# Altium project Ezlo_Voice_AssistantHUB.PrjPcb (part 9 of 10)

## Sheet SDIO_SDMMC_Sheet.SchDoc
size A4; DocumentNumber: 18; SheetNumber: 18; SheetTotal: 27
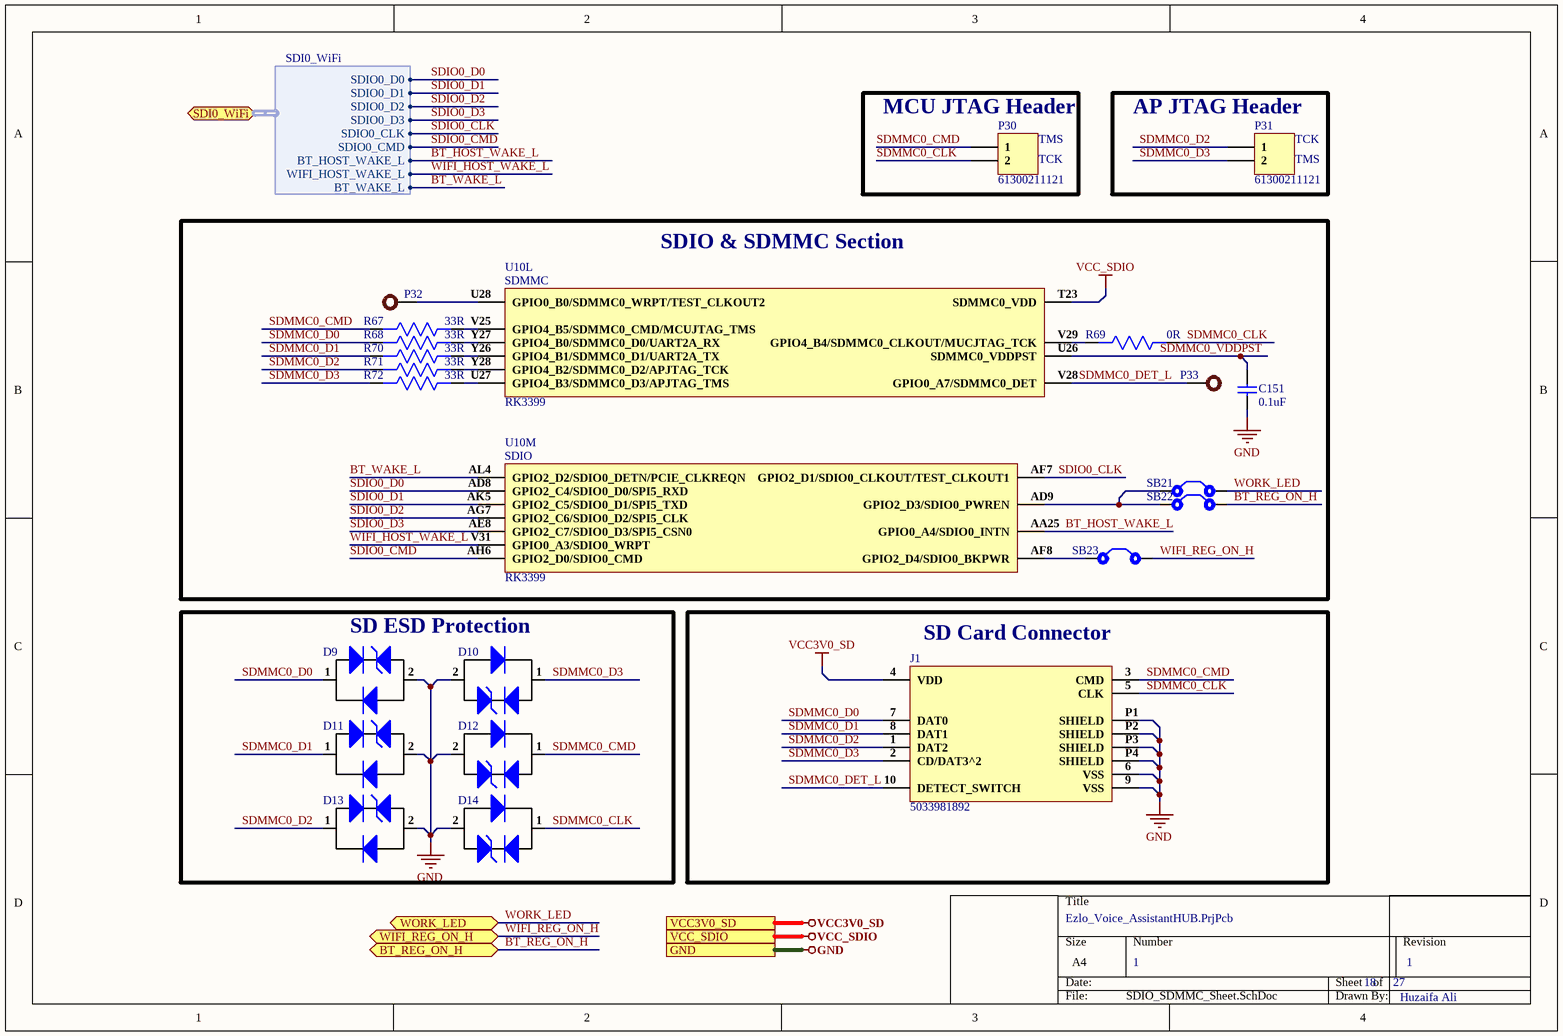
[diagram p20: SDIO_SDMMC_Sheet.SchDoc]

### Parts
C151  0.1uF  [Cap0402]
D9  ESD9X5VU  [DFN1006-2L]  (value not drawn)
D10  ESD9X5VU  [DFN1006-2L]  (value not drawn)
D11  ESD9X5VU  [DFN1006-2L]  (value not drawn)
D12  ESD9X5VU  [DFN1006-2L]  (value not drawn)
D13  ESD9X5VU  [DFN1006-2L]  (value not drawn)
D14  ESD9X5VU  [DFN1006-2L]  (value not drawn)
J1  5033981892  [503398-1892]
P30  61300211121  [HDR1X2]
P31  61300211121  [HDR1X2]
P32  Test Point  [TEST POINT]  (value not drawn)
P33  TEST POINT  [TEST POINT]  (value not drawn)
R67  33R  [Res0603]
R68  33R  [Res0603]
R69  0R  [Res0603]
R70  33R  [Res0603]
R71  33R  [Res0603]
R72  33R  [Res0603]
SB21  Solder Bridge  [Solder Bridge]  (value not drawn)
SB22  Solder Bridge  [Solder Bridge]  (value not drawn)
SB23  Solder Bridge  [Solder Bridge]  (value not drawn)
U10  RK3399  [RK3399]  (parts L,M of 34)

### Blocks framed on the sheet
MCU JTAG Header: P30
AP JTAG Header: P31
SDIO & SDMMC Section: C151 P32 P33 R67-R72 SB21-SB23 U10
SD ESD Protection: D9-D14
SD Card Connector: J1

### Ports
BT_REG_ON_H (bidir), GND, SDI0_WiFi (bidir, harness SDI0_WiFi), VCC3V0_SD, VCC_SDIO, WIFI_REG_ON_H (bidir), WORK_LED (bidir)

### Harnesses
SDI0_WiFi: SDIO0_D0, SDIO0_D1, SDIO0_D2, SDIO0_D3, SDIO0_CLK, SDIO0_CMD, BT_HOST_WAKE_L, WIFI_HOST_WAKE_L, BT_WAKE_L

### Nets
GND: C151.1 D9.2 D10.2 D11.2 D12.2 D13.2 D14.2 J1.6(VSS) J1.9(VSS) J1.P1(SHIELD) J1.P2(SHIELD) J1.P3(SHIELD) J1.P4(SHIELD) ; port GND
VCC3V0_SD: J1.4(VDD) ; port VCC3V0_SD
VCC_SDIO: U10.T23(SDMMC0_VDD) ; port VCC_SDIO
BT_HOST_WAKE_L: U10.AA25(GPIO0_A4/SDIO0_INTN) ; port SDI0_WiFi.BT_HOST_WAKE_L
BT_REG_ON_H: SB22.2 ; port BT_REG_ON_H
BT_WAKE_L: U10.AL4(GPIO2_D2/SDIO0_DETN/PCIE_CLKREQN) ; port SDI0_WiFi.BT_WAKE_L
SDIO0_CLK: U10.AF7(GPIO2_D1/SDIO0_CLKOUT/TEST_CLKOUT1) ; port SDI0_WiFi.SDIO0_CLK  [project net SDI0_WiFi.SDIO0_CLK]
SDIO0_CMD: U10.AH6(GPIO2_D0/SDIO0_CMD) ; port SDI0_WiFi.SDIO0_CMD  [project net SDI0_WiFi.SDIO0_CMD]
SDIO0_D0: U10.AD8(GPIO2_C4/SDIO0_D0/SPI5_RXD) ; port SDI0_WiFi.SDIO0_D0  [project net SDI0_WiFi.SDIO0_D0]
SDIO0_D1: U10.AK5(GPIO2_C5/SDIO0_D1/SPI5_TXD) ; port SDI0_WiFi.SDIO0_D1  [project net SDI0_WiFi.SDIO0_D1]
SDIO0_D2: U10.AG7(GPIO2_C6/SDIO0_D2/SPI5_CLK) ; port SDI0_WiFi.SDIO0_D2  [project net SDI0_WiFi.SDIO0_D2]
SDIO0_D3: U10.AE8(GPIO2_C7/SDIO0_D3/SPI5_CSN0) ; port SDI0_WiFi.SDIO0_D3  [project net SDI0_WiFi.SDIO0_D3]
SDMMC0_CLK: D14.1 J1.5(CLK) P30.2 R69.1
SDMMC0_CMD: D12.1 J1.3(CMD) P30.1 R67.2
SDMMC0_D0: D9.1 J1.7(DAT0) R68.2
SDMMC0_D1: D11.1 J1.8(DAT1) R70.2
SDMMC0_D2: D13.1 J1.1(DAT2) P31.1 R71.2
SDMMC0_D3: D10.1 J1.2(CD/DAT3^2) P31.2 R72.2
SDMMC0_DET_L: J1.10(DETECT_SWITCH) P33.1 U10.V28(GPIO0_A7/SDMMC0_DET)
SDMMC0_VDDPST: C151.2 U10.U26(SDMMC0_VDDPST)
WIFI_HOST_WAKE_L: U10.V31(GPIO0_A3/SDIO0_WRPT) ; port SDI0_WiFi.WIFI_HOST_WAKE_L  [project net SDI0_WiFi.WIFI_HOST_WAKE_L]
WIFI_REG_ON_H: SB23.2 ; port WIFI_REG_ON_H
WORK_LED: SB21.2 ; port WORK_LED
NetP32_1: P32.1 U10.U28(GPIO0_B0/SDMMC0_WRPT/TEST_CLKOUT2)
NetR67_1: R67.1 U10.V25(GPIO4_B5/SDMMC0_CMD/MCUJTAG_TMS)
NetR68_1: R68.1 U10.Y27(GPIO4_B0/SDMMC0_D0/UART2A_RX)
NetR69_2: R69.2 U10.V29(GPIO4_B4/SDMMC0_CLKOUT/MUCJTAG_TCK)
NetR70_1: R70.1 U10.Y26(GPIO4_B1/SDMMC0_D1/UART2A_TX)
NetR71_1: R71.1 U10.Y28(GPIO4_B2/SDMMC0_D2/APJTAG_TCK)
NetR72_1: R72.1 U10.U27(GPIO4_B3/SDMMC0_D3/APJTAG_TMS)
NetSB21_1: SB21.1 SB22.1 U10.AD9(GPIO2_D3/SDIO0_PWREN)
NetSB23_1: SB23.1 U10.AF8(GPIO2_D4/SDIO0_BKPWR)

### Notes on the sheet
- (near P30) TMS
- (near P30) TCK
- (near P31) TCK
- (near P31) TMS
- 1
- Huzaifa Ali
- (in symbol RK3399, part L) SDMMC
- (in symbol RK3399, part M) SDIO

### Library data of the parts
C151 = CC0402KRX5R6BB104: as C152-C160 on sheet USB_Sheet; Supplier 1: Digi-Key; Manufacturer Part Number: CC0402KRX5R6BB104; RoHS: Yes; Category: Ceramic Capacitors; Stock 1: 6385580; Pricing 1: 1=0.10000, 10=0.02700, 50=0.01500, 100=0.01220, 500=0.00874, 1000=0.00687, 2500=0.00625, 5000=0.00575 (USD); Mount: Surface Mount; Case/Package: 0402; Number of Pins: 2; Case Code (Imperial): 0402; Case Code (Metric): 1005; Min Operating Temperature: -55°C; Max Operating Temperature: 85°C; Dielectric: X5R; Packaging: Tape and Reel; Voltage Rating: 10V; Package Quantity: 1; Termination: SMD/SMT; Voltage Rating (DC): 10V; Series: CC; Length: 1mm; Width: 0.02inch; Height: 0.5mm; Depth: 0.5mm; Thickness: 0.022inch; Radiation Hardening: No; RoHS Compliant: Yes; REACH SVHC: No SVHC; Lead Free: Lead Free; Halogen Free: Halogen Free; ComponentLink1URL: https://datasheet.ciiva.com/144/mlccorderingcode-144029.pdf?src-supplier=Digi-Key; ComponentLink1Description: https://datasheet.ciiva.com/144/mlccorderingcode-144029.pdf?src-supplier=Digi-Key; ComponentLink2URL: https://datasheet.ciiva.com/144/mlccorderingcode-144028.pdf?src-supplier=Digi-Key; ComponentLink2Description: https://datasheet.ciiva.com/144/mlccorderingcode-144028.pdf?src-supplier=Digi-Key; ComponentLink3URL: https://datasheet.ciiva.com/144/mlccorderingcode-144030.pdf?src-supplier=Digi-Key; ComponentLink3Description: https://datasheet.ciiva.com/144/mlccorderingcode-144030.pdf?src-supplier=Digi-Key; ComponentLink4URL: https://datasheet.ciiva.com/7978/1359354-7978091.pdf?src-supplier=Element14; ComponentLink4Description: https://datasheet.ciiva.com/7978/1359354-7978091.pdf?src-supplier=Element14; ComponentLink5URL: https://datasheet.ciiva.com/11587/upy-gphc-x5r-4v-to-50v-12-11587302.pdf?src-supplier=Avnet; ComponentLink5Description: https://datasheet.ciiva.com/11587/upy-gphc-x5r-4v-to-50v-12-11587302.pdf?src-supplier=Avnet; Supplier Part Number 1: 311-1336-1-ND
D9-D14 = ESD9X5VU: DFN1006-2 ESD Protection Devices ROHS; Manufacturer: TECH PUBLIC; Manufacturer Part Number: ESD9X5VU; Footprint: DFN1006-2; ComponentLink1Description: LCSC; ComponentLink1URL: https://www.lcsc.com/product-detail/span-style-background-color-ff0-ESD-span-Protection-Devices_TECH-PUBLIC-ESD9X5VU_C2875160.html
J1 = 5033981892: MICRO SD PUSH/PUSH SMALL 8C; Manufacturer: Molex; Supplier 1: Arrow Electronics; Manufacturer Part Number: 503398-1892; RoHS: Yes; Category: Memory Connectors; Stock 1: 14535; Pricing 1: 1=2.47900, 10=2.18900, 25=2.17400, 100=1.81200 (USD); ComponentLink1URL: https://datasheet.ciiva.com/29723/5033981892-sd-29723401.pdf?src-supplier=Digi-Key; ComponentLink1Description: https://datasheet.ciiva.com/29723/5033981892-sd-29723401.pdf?src-supplier=Digi-Key; ComponentLink2URL: https://datasheet.ciiva.com/22744/1740946-22744573.pdf?src-supplier=Element14; ComponentLink2Description: https://datasheet.ciiva.com/22744/1740946-22744573.pdf?src-supplier=Element14; ComponentLink3URL: https://datasheet.ciiva.com/23941/1740947-23941665.pdf?src-supplier=Newark; ComponentLink3Description: https://datasheet.ciiva.com/23941/1740947-23941665.pdf?src-supplier=Newark; Supplier Part Number 1: 503398-1892
P30 P31 = 61300211121: CONN HEADER VERT 2POS 2.54MM; Manufacturer: Wurth Electronics; Current Rating: 3A; Voltage Rating: 250V; Number of Positions: 2; Gender: Male; Connector Type: Male Pin; Pitch: 0.1inch; Supplier 1: Digi-Key; Manufacturer Part Number: 61300211121; Stock 1: 219205; Pricing 1: 1=0.13, 10=0.106, 25=0.088, 50=0.074, 100=0.067, 1000=0.061 (USD); Mount: Through Hole; Contact Plating: Gold; Housing Material: PBT; Contact Material: Copper Alloy,Copper; Color: Black; Min Operating Temperature: -40°C; Max Operating Temperature: 125°C; Number of Rows: 1; Contact Gender: Male; Packaging: Bulk; Termination: Through Hole; Number of Contacts: 2; Contact Mating Length: 0.236inch; REACH SVHC: Unknown; Lead Free: Lead Free; ComponentLink1URL: http://www.mouser.com/ds/2/445/6130xx11121-538006.pdf?src-supplier=Mouser; ComponentLink1Description: http://www.mouser.com/ds/2/445/6130xx11121-538006.pdf?src-supplier=Mouser; Supplier Part Number 1: 732-5315-ND
P32 P33 = TEST POINT: Test Point ON
R67 R68 R70-R72 = RC0603FR-0733RL: RES SMD 33 OHM 1% 1/10W 0603; Manufacturer: Yageo; Temperature Coefficient: 100ppm/°C; Voltage Rating (DC): 50V; Power Rating: 100mW; Voltage Rating: 75V; Supplier 1: Digi-Key; Manufacturer Part Number: RC0603FR-0733RL; Stock 1: 5529439; Pricing 1: 1=0.1, 10=0.023, 100=0.0094, 1000=0.00421, 2500=0.00366 (USD); Case/Package: 0603; Number of Pins: 2; Weight: 7.1E-05oz; Case Code (Metric): 1608; Case Code (Imperial): 0603; Min Operating Temperature: -55°C; Max Operating Temperature: 155°C; Resistance: 33R; Tolerance: 1%; Composition: Thick Film; Packaging: Tape and Reel; Package Quantity: 1; Number of Terminations: 2; Termination: SMD/SMT; Military Standard: Not; Max Power Dissipation: 100mW; Features: Moisture Resistant; Length: 1.6mm; Height: 0.45mm; Width: 0.8mm; Depth: 0.8mm; Lead Pitch: 0.3mm; REACH SVHC: No SVHC; Lead Free: Lead Free; ComponentLink1URL: http://www.yageo.com/documents/recent/PYu-RC_Group_51_RoHS_L_10.pdf?src-supplier=Digi-Key; ComponentLink1Description: http://www.yageo.com/documents/recent/PYu-RC_Group_51_RoHS_L_10.pdf?src-supplier=Digi-Key; ComponentLink2URL: http://documents.rs-components.com/techlib://itc_doclist_GB.htm?stockno=5046562&src-supplier=RSComponents; ComponentLink2Description: http://documents.rs-components.com/techlib://itc_doclist_GB.htm?stockno=5046562&src-supplier=RSComponents; ComponentLink3URL: http://www.farnell.com/datasheets/38590.pdf?src-supplier=Element14; ComponentLink3Description: http://www.farnell.com/datasheets/38590.pdf?src-supplier=Element14; ComponentLink4URL: https://www.verical.com/server-webapp/html/getDatasheet?partID=326673&src-supplier=Verical; ComponentLink4Description: https://www.verical.com/server-webapp/html/getDatasheet?partID=326673&src-supplier=Verical; ComponentLink5URL: http://www.farnell.com/datasheets/1868787.pdf?src-supplier=Element14; ComponentLink5Description: http://www.farnell.com/datasheets/1868787.pdf?src-supplier=Element14; ComponentLink6URL: http://www.farnell.com/datasheets/2167052.pdf?src-supplier=Element14; ComponentLink6Description: http://www.farnell.com/datasheets/2167052.pdf?src-supplier=Element14; ComponentLink7URL: http://www.farnell.com/datasheets/443971.pdf?src-supplier=Element14; ComponentLink7Description: http://www.farnell.com/datasheets/443971.pdf?src-supplier=Element14; Supplier Part Number 1: 311-33.0HRCT-ND
R69 = RC0603FR-070RL: RES SMD 0R, 1%, 0.1W, 0603; Manufacturer: Yageo; Resistance: 0mR; Power Rating: 100mW; Voltage Rating (DC): 50V; Temperature Coefficient: 200ppm/°C; Current Rating: 1A; Working Voltage: 75V; Supplier 1: Arrow Electronics; Manufacturer Part Number: RC0603FR-070RL; RoHS: Yes; Category: Chip SMD Resistors; Stock 1: 1270000; Pricing 1: 5000=0.00320, 5000=0.00490, 50000=0.00450, 500000=0.00250, 2500000=0.00150 (USD); Case/Package: 0603; Number of Pins: 2; Contact Plating: Tin,Matte; Case Code (Metric): 1608; Case Code (Imperial): 0603; Min Operating Temperature: -55°C; Max Operating Temperature: 155°C; Resistor Type: Thick Film; Packaging: Tape and Reel; Tolerance: 1%; Package Quantity: 5000; Voltage Rating: 50V; Number of Terminations: 2; Termination: SMD/SMT; Max Power Dissipation: 100mW; Features: Moisture Resistant; Length: 1.6mm; Width: 0.031inch; Height: 0.45mm; Depth: 0.8mm; Radiation Hardening: No; REACH SVHC: No SVHC; Lead Free: Lead Free; Military Standard: Not; ComponentLink1URL: https://datasheet.ciiva.com/11808/0900766b80f96399-11808172.pdf?src-supplier=RSComponents; ComponentLink1Description: https://datasheet.ciiva.com/11808/0900766b80f96399-11808172.pdf?src-supplier=RSComponents; ComponentLink2URL: https://datasheet.ciiva.com/5558/rc0603-272842-5558341.pdf?src-supplier=Mouser; ComponentLink2Description: https://datasheet.ciiva.com/5558/rc0603-272842-5558341.pdf?src-supplier=Mouser; ComponentLink3URL: https://datasheet.ciiva.com/46382/443971-46382072.pdf?src-supplier=Element14; ComponentLink3Description: https://datasheet.ciiva.com/46382/443971-46382072.pdf?src-supplier=Element14; ComponentLink4URL: https://datasheet.ciiva.com/29721/pyu-r-int-thick-7-29721178.pdf?src-supplier=Digi-Key; ComponentLink4Description: https://datasheet.ciiva.com/29721/pyu-r-int-thick-7-29721178.pdf?src-supplier=Digi-Key; ComponentLink5URL: https://datasheet.ciiva.com/5684/443971-5684699.pdf?src-supplier=Farnell; ComponentLink5Description: https://datasheet.ciiva.com/5684/443971-5684699.pdf?src-supplier=Farnell; ComponentLink6URL: https://datasheet.ciiva.com/7983/443971-7983627.pdf?src-supplier=Element14; ComponentLink6Description: https://datasheet.ciiva.com/7983/443971-7983627.pdf?src-supplier=Element14; ComponentLink7URL: https://datasheet.ciiva.com/29721/pyu-rc0603-51-rohs-l-4-29721179.pdf?src-supplier=Digi-Key; ComponentLink7Description: https://datasheet.ciiva.com/29721/pyu-rc0603-51-rohs-l-4-29721179.pdf?src-supplier=Digi-Key; ComponentLink8URL: https://datasheet.ciiva.com/22643/1868787-22643388.pdf?src-supplier=Element14; ComponentLink8Description: https://datasheet.ciiva.com/22643/1868787-22643388.pdf?src-supplier=Element14; Supplier Part Number 1: RC0603FR-070RL
SB21-SB23 = Solder Bridge: Solder Bridge ON
U10 = RK3399: RK3399 CPU BGA for HD set-top box chip BGA Chipse; Manufacturer: Fuzhou Rockchip Electronics; ComponentLink1Description: Aliexpress; ComponentLink1URL: https://www.aliexpress.com/item/1005001971093459.html?spm=a2g0n.productlist.0.0.3c7csv8Qsv8Quh&browser_id=3ac7e9efb8074641aaabc4d871f09748&aff_trace_key=&aff_platform=msite&m_page_id=181389a08711fc2600d8cc522bab8d702dd4189be0&gclid=&pdp_npi=2%40dis%21USD%21%2123.6%21%21%21%21%21%402101d91e16545120399167831e8b89%21%21sea&algo_pvid=4303aedd-774c-4013-953d-920f10b55003; Manufacturer Part Number: RK3399; Footprint: FCBGA828

## Sheet DDRC_Section.SchDoc: =Projectname
size A4; DocumentNumber: 9; SheetNumber: 9; SheetTotal: 27
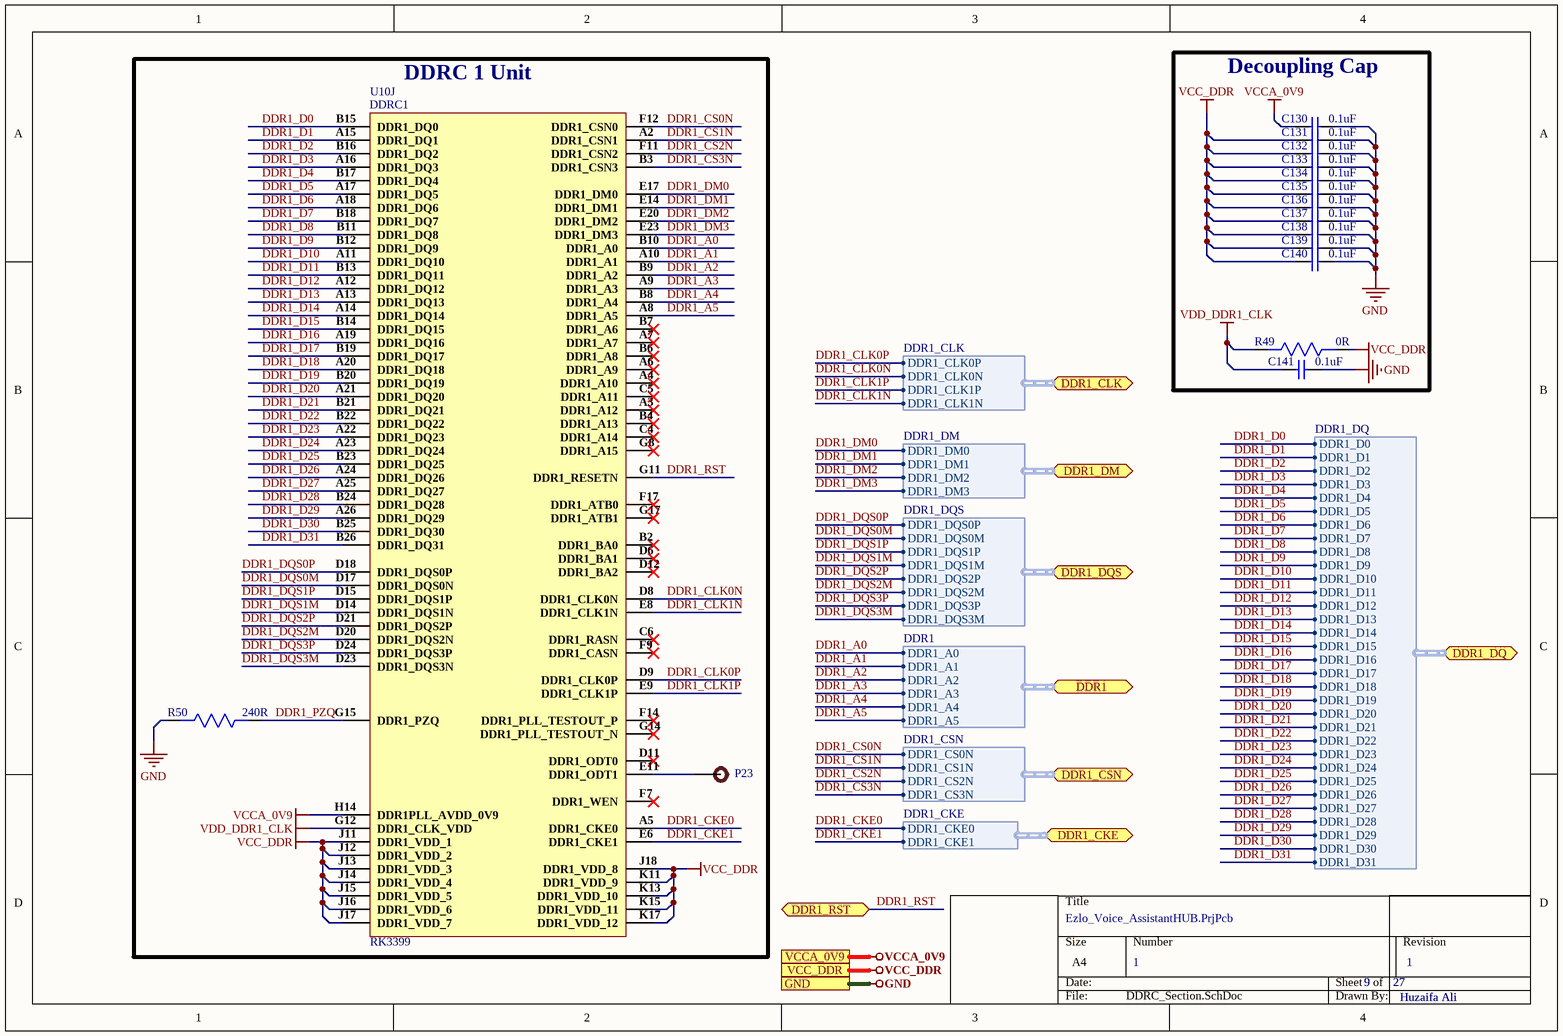
[diagram p21: DDRC_Section.SchDoc]

### Parts
C130  0.1uF  [Cap0402]
C131  0.1uF  [Cap0402]
C132  0.1uF  [Cap0402]
C133  0.1uF  [Cap0402]
C134  0.1uF  [Cap0402]
C135  0.1uF  [Cap0402]
C136  0.1uF  [Cap0402]
C137  0.1uF  [Cap0402]
C138  0.1uF  [Cap0402]
C139  0.1uF  [Cap0402]
C140  0.1uF  [Cap0402]
C141  0.1uF  [Cap0402]
P23  Test Point  [TEST POINT]  (value not drawn)
R49  0R  [Res0603]
R50  240R  [Res0603]
U10  RK3399  [RK3399]  (part J of 34)

### Blocks framed on the sheet
DDRC 1 Unit: P23 R50 U10
Decoupling Cap: C130-C141 R49

### Ports
DDR1 (bidir, harness DDR1), DDR1_CKE (bidir, harness DDR1_CKE), DDR1_CLK (bidir, harness DDR1_CLK), DDR1_CSN (bidir, harness DDR1_CSN), DDR1_DM (bidir, harness DDR1_DM), DDR1_DQ (bidir, harness DDR1_DQ), DDR1_DQS (bidir, harness DDR1_DQS), DDR1_RST (bidir), GND, VCC_DDR, VCCA_0V9

### Harnesses
DDR1_DQ: DDR1_D0, DDR1_D1, DDR1_D2, DDR1_D3, DDR1_D4, DDR1_D5, DDR1_D6, DDR1_D7, DDR1_D8, DDR1_D9, DDR1_D10, DDR1_D11, DDR1_D12, DDR1_D13, DDR1_D14, DDR1_D15, DDR1_D16, DDR1_D17, DDR1_D18, DDR1_D19, DDR1_D20, DDR1_D21, DDR1_D22, DDR1_D23, DDR1_D24, DDR1_D25, DDR1_D26, DDR1_D27, DDR1_D28, DDR1_D29, DDR1_D30, DDR1_D31
DDR1_DM: DDR1_DM0, DDR1_DM1, DDR1_DM2, DDR1_DM3
DDR1_DQS: DDR1_DQS0P, DDR1_DQS0M, DDR1_DQS1P, DDR1_DQS1M, DDR1_DQS2P, DDR1_DQS2M, DDR1_DQS3P, DDR1_DQS3M
DDR1: DDR1_A0, DDR1_A1, DDR1_A2, DDR1_A3, DDR1_A4, DDR1_A5
DDR1_CSN: DDR1_CS0N, DDR1_CS1N, DDR1_CS2N, DDR1_CS3N
DDR1_CKE: DDR1_CKE0, DDR1_CKE1
DDR1_CLK: DDR1_CLK0P, DDR1_CLK0N, DDR1_CLK1P, DDR1_CLK1N

### Nets
GND: C130.2 C131.2 C132.2 C133.2 C134.2 C135.2 C136.2 C137.2 C138.2 C139.2 C140.2 C141.2 R50.2 ; port GND
VCC_DDR: C131.1 C132.1 C133.1 C134.1 C135.1 C136.1 C137.1 C138.1 C139.1 C140.1 R49.1 U10.J11(DDR1_VDD_1) U10.J12(DDR1_VDD_2) U10.J13(DDR1_VDD_3) U10.J14(DDR1_VDD_4) U10.J15(DDR1_VDD_5) U10.J16(DDR1_VDD_6) U10.J17(DDR1_VDD_7) U10.J18(DDR1_VDD_8) U10.K11(DDR1_VDD_9) U10.K13(DDR1_VDD_10) U10.K15(DDR1_VDD_11) U10.K17(DDR1_VDD_12) ; port VCC_DDR
VCCA_0V9: C130.1 U10.H14(DDR1PLL_AVDD_0V9) ; port VCCA_0V9
VDD_DDR1_CLK: C141.1 R49.2 U10.G12(DDR1_CLK_VDD)
DDR1_A0: U10.B10(DDR1_A0) ; port DDR1.DDR1_A0  [project net DDR1.DDR1_A0]
DDR1_A1: U10.A10(DDR1_A1) ; port DDR1.DDR1_A1  [project net DDR1.DDR1_A1]
DDR1_A2: U10.B9(DDR1_A2) ; port DDR1.DDR1_A2  [project net DDR1.DDR1_A2]
DDR1_A3: U10.A9(DDR1_A3) ; port DDR1.DDR1_A3  [project net DDR1.DDR1_A3]
DDR1_A4: U10.B8(DDR1_A4) ; port DDR1.DDR1_A4  [project net DDR1.DDR1_A4]
DDR1_A5: U10.A8(DDR1_A5) ; port DDR1.DDR1_A5  [project net DDR1.DDR1_A5]
DDR1_CKE0: U10.A5(DDR1_CKE0) ; port DDR1_CKE.DDR1_CKE0  [project net DDR1_CKE.DDR1_CKE0]
DDR1_CKE1: U10.E6(DDR1_CKE1) ; port DDR1_CKE.DDR1_CKE1  [project net DDR1_CKE.DDR1_CKE1]
DDR1_CLK0N: U10.D8(DDR1_CLK0N) ; port DDR1_CLK.DDR1_CLK0N  [project net DDR1_CLK.DDR1_CLK0N]
DDR1_CLK0P: U10.D9(DDR1_CLK0P) ; port DDR1_CLK.DDR1_CLK0P  [project net DDR1_CLK.DDR1_CLK0P]
DDR1_CLK1N: U10.E8(DDR1_CLK1N) ; port DDR1_CLK.DDR1_CLK1N  [project net DDR1_CLK.DDR1_CLK1N]
DDR1_CLK1P: U10.E9(DDR1_CLK1P) ; port DDR1_CLK.DDR1_CLK1P  [project net DDR1_CLK.DDR1_CLK1P]
DDR1_CS0N: U10.F12(DDR1_CSN0) ; port DDR1_CSN.DDR1_CS0N
DDR1_CS1N: U10.A2(DDR1_CSN1) ; port DDR1_CSN.DDR1_CS1N
DDR1_CS2N: U10.F11(DDR1_CSN2) ; port DDR1_CSN.DDR1_CS2N
DDR1_CS3N: U10.B3(DDR1_CSN3) ; port DDR1_CSN.DDR1_CS3N
DDR1_D0: U10.B15(DDR1_DQ0) ; port DDR1_DQ.DDR1_D0
DDR1_D1: U10.A15(DDR1_DQ1) ; port DDR1_DQ.DDR1_D1
DDR1_D2: U10.B16(DDR1_DQ2) ; port DDR1_DQ.DDR1_D2
DDR1_D3: U10.A16(DDR1_DQ3) ; port DDR1_DQ.DDR1_D3
DDR1_D4: U10.B17(DDR1_DQ4) ; port DDR1_DQ.DDR1_D4
DDR1_D5: U10.A17(DDR1_DQ5) ; port DDR1_DQ.DDR1_D5
DDR1_D6: U10.A18(DDR1_DQ6) ; port DDR1_DQ.DDR1_D6
DDR1_D7: U10.B18(DDR1_DQ7) ; port DDR1_DQ.DDR1_D7
DDR1_D8: U10.B11(DDR1_DQ8) ; port DDR1_DQ.DDR1_D8
DDR1_D9: U10.B12(DDR1_DQ9) ; port DDR1_DQ.DDR1_D9
DDR1_D10: U10.A11(DDR1_DQ10) ; port DDR1_DQ.DDR1_D10
DDR1_D11: U10.B13(DDR1_DQ11) ; port DDR1_DQ.DDR1_D11
DDR1_D12: U10.A12(DDR1_DQ12) ; port DDR1_DQ.DDR1_D12
DDR1_D13: U10.A13(DDR1_DQ13) ; port DDR1_DQ.DDR1_D13
DDR1_D14: U10.A14(DDR1_DQ14) ; port DDR1_DQ.DDR1_D14
DDR1_D15: U10.B14(DDR1_DQ15) ; port DDR1_DQ.DDR1_D15
DDR1_D16: U10.A19(DDR1_DQ16) ; port DDR1_DQ.DDR1_D16
DDR1_D17: U10.B19(DDR1_DQ17) ; port DDR1_DQ.DDR1_D17
DDR1_D18: U10.A20(DDR1_DQ18) ; port DDR1_DQ.DDR1_D18
DDR1_D19: U10.B20(DDR1_DQ19) ; port DDR1_DQ.DDR1_D19
DDR1_D20: U10.A21(DDR1_DQ20) ; port DDR1_DQ.DDR1_D20
DDR1_D21: U10.B21(DDR1_DQ21) ; port DDR1_DQ.DDR1_D21
DDR1_D22: U10.B22(DDR1_DQ22) ; port DDR1_DQ.DDR1_D22
DDR1_D23: U10.A22(DDR1_DQ23) ; port DDR1_DQ.DDR1_D23
DDR1_D24: U10.A23(DDR1_DQ24) ; port DDR1_DQ.DDR1_D24
DDR1_D25: U10.B23(DDR1_DQ25) ; port DDR1_DQ.DDR1_D25
DDR1_D26: U10.A24(DDR1_DQ26) ; port DDR1_DQ.DDR1_D26
DDR1_D27: U10.A25(DDR1_DQ27) ; port DDR1_DQ.DDR1_D27
DDR1_D28: U10.B24(DDR1_DQ28) ; port DDR1_DQ.DDR1_D28
DDR1_D29: U10.A26(DDR1_DQ29) ; port DDR1_DQ.DDR1_D29
DDR1_D30: U10.B25(DDR1_DQ30) ; port DDR1_DQ.DDR1_D30
DDR1_D31: U10.B26(DDR1_DQ31) ; port DDR1_DQ.DDR1_D31
DDR1_DM0: U10.E17(DDR1_DM0) ; port DDR1_DM.DDR1_DM0  [project net DDR1_DM.DDR1_DM0]
DDR1_DM1: U10.E14(DDR1_DM1) ; port DDR1_DM.DDR1_DM1  [project net DDR1_DM.DDR1_DM1]
DDR1_DM2: U10.E20(DDR1_DM2) ; port DDR1_DM.DDR1_DM2  [project net DDR1_DM.DDR1_DM2]
DDR1_DM3: U10.E23(DDR1_DM3) ; port DDR1_DM.DDR1_DM3  [project net DDR1_DM.DDR1_DM3]
DDR1_DQS0M: U10.D17(DDR1_DQS0N) ; port DDR1_DQS.DDR1_DQS0M  [project net DDR1_DQS.DDR1_DQS0M]
DDR1_DQS0P: U10.D18(DDR1_DQS0P) ; port DDR1_DQS.DDR1_DQS0P  [project net DDR1_DQS.DDR1_DQS0P]
DDR1_DQS1M: U10.D14(DDR1_DQS1N) ; port DDR1_DQS.DDR1_DQS1M  [project net DDR1_DQS.DDR1_DQS1M]
DDR1_DQS1P: U10.D15(DDR1_DQS1P) ; port DDR1_DQS.DDR1_DQS1P  [project net DDR1_DQS.DDR1_DQS1P]
DDR1_DQS2M: U10.D20(DDR1_DQS2N) ; port DDR1_DQS.DDR1_DQS2M  [project net DDR1_DQS.DDR1_DQS2M]
DDR1_DQS2P: U10.D21(DDR1_DQS2P) ; port DDR1_DQS.DDR1_DQS2P  [project net DDR1_DQS.DDR1_DQS2P]
DDR1_DQS3M: U10.D23(DDR1_DQS3N) ; port DDR1_DQS.DDR1_DQS3M  [project net DDR1_DQS.DDR1_DQS3M]
DDR1_DQS3P: U10.D24(DDR1_DQS3P) ; port DDR1_DQS.DDR1_DQS3P  [project net DDR1_DQS.DDR1_DQS3P]
DDR1_PZQ: R50.1 U10.G15(DDR1_PZQ)
DDR1_RST: U10.G11(DDR1_RESETN) ; port DDR1_RST
NetP23_1: P23.1 U10.E11(DDR1_ODT1)

Not connected (* = marked no-connect by the designer): U10 A3(DDR1_A12)* A4(DDR1_A10)* A6(DDR1_A9)* A7(DDR1_A7)* B2(DDR1_BA0)* B4(DDR1_A13)* B6(DDR1_A8)* B7(DDR1_A6)* C4(DDR1_A14)* C5(DDR1_A11)* C6(DDR1_RASN)* D6(DDR1_BA1)* D11(DDR1_ODT0)* D12(DDR1_BA2)* F7(DDR1_WEN)* F9(DDR1_CASN)* F14(DDR1_PLL_TESTOUT_P)* F17(DDR1_ATB0)* G8(DDR1_A15)* G14(DDR1_PLL_TESTOUT_N)* G17(DDR1_ATB1)*

### Notes on the sheet
- Huzaifa Ali
- 1
- (in symbol RK3399, part J) DDRC1

### Library data of the parts
C130-C141 = CC0402KRX5R6BB104: as C152-C160 on sheet USB_Sheet; Supplier 1: Digi-Key; Manufacturer Part Number: CC0402KRX5R6BB104; RoHS: Yes; Category: Ceramic Capacitors; Stock 1: 6385580; Pricing 1: 1=0.10000, 10=0.02700, 50=0.01500, 100=0.01220, 500=0.00874, 1000=0.00687, 2500=0.00625, 5000=0.00575 (USD); Mount: Surface Mount; Case/Package: 0402; Number of Pins: 2; Case Code (Imperial): 0402; Case Code (Metric): 1005; Min Operating Temperature: -55°C; Max Operating Temperature: 85°C; Dielectric: X5R; Packaging: Tape and Reel; Voltage Rating: 10V; Package Quantity: 1; Termination: SMD/SMT; Voltage Rating (DC): 10V; Series: CC; Length: 1mm; Width: 0.02inch; Height: 0.5mm; Depth: 0.5mm; Thickness: 0.022inch; Radiation Hardening: No; RoHS Compliant: Yes; REACH SVHC: No SVHC; Lead Free: Lead Free; Halogen Free: Halogen Free; ComponentLink1URL: https://datasheet.ciiva.com/144/mlccorderingcode-144029.pdf?src-supplier=Digi-Key; ComponentLink1Description: https://datasheet.ciiva.com/144/mlccorderingcode-144029.pdf?src-supplier=Digi-Key; ComponentLink2URL: https://datasheet.ciiva.com/144/mlccorderingcode-144028.pdf?src-supplier=Digi-Key; ComponentLink2Description: https://datasheet.ciiva.com/144/mlccorderingcode-144028.pdf?src-supplier=Digi-Key; ComponentLink3URL: https://datasheet.ciiva.com/144/mlccorderingcode-144030.pdf?src-supplier=Digi-Key; ComponentLink3Description: https://datasheet.ciiva.com/144/mlccorderingcode-144030.pdf?src-supplier=Digi-Key; ComponentLink4URL: https://datasheet.ciiva.com/7978/1359354-7978091.pdf?src-supplier=Element14; ComponentLink4Description: https://datasheet.ciiva.com/7978/1359354-7978091.pdf?src-supplier=Element14; ComponentLink5URL: https://datasheet.ciiva.com/11587/upy-gphc-x5r-4v-to-50v-12-11587302.pdf?src-supplier=Avnet; ComponentLink5Description: https://datasheet.ciiva.com/11587/upy-gphc-x5r-4v-to-50v-12-11587302.pdf?src-supplier=Avnet; Supplier Part Number 1: 311-1336-1-ND
P23 = TEST POINT: Test Point ON
R49 = RC0603FR-070RL: as R69 on sheet SDIO_SDMMC_Sheet; Supplier 1: Arrow Electronics; Manufacturer Part Number: RC0603FR-070RL; RoHS: Yes; Category: Chip SMD Resistors; Stock 1: 1270000; Pricing 1: 5000=0.00320, 5000=0.00490, 50000=0.00450, 500000=0.00250, 2500000=0.00150 (USD); Case/Package: 0603; Number of Pins: 2; Contact Plating: Tin,Matte; Case Code (Metric): 1608; Case Code (Imperial): 0603; Min Operating Temperature: -55°C; Max Operating Temperature: 155°C; Resistor Type: Thick Film; Packaging: Tape and Reel; Tolerance: 1%; Package Quantity: 5000; Voltage Rating: 50V; Number of Terminations: 2; Termination: SMD/SMT; Max Power Dissipation: 100mW; Features: Moisture Resistant; Length: 1.6mm; Width: 0.031inch; Height: 0.45mm; Depth: 0.8mm; Radiation Hardening: No; REACH SVHC: No SVHC; Lead Free: Lead Free; Military Standard: Not; ComponentLink1URL: https://datasheet.ciiva.com/11808/0900766b80f96399-11808172.pdf?src-supplier=RSComponents; ComponentLink1Description: https://datasheet.ciiva.com/11808/0900766b80f96399-11808172.pdf?src-supplier=RSComponents; ComponentLink2URL: https://datasheet.ciiva.com/5558/rc0603-272842-5558341.pdf?src-supplier=Mouser; ComponentLink2Description: https://datasheet.ciiva.com/5558/rc0603-272842-5558341.pdf?src-supplier=Mouser; ComponentLink3URL: https://datasheet.ciiva.com/46382/443971-46382072.pdf?src-supplier=Element14; ComponentLink3Description: https://datasheet.ciiva.com/46382/443971-46382072.pdf?src-supplier=Element14; ComponentLink4URL: https://datasheet.ciiva.com/29721/pyu-r-int-thick-7-29721178.pdf?src-supplier=Digi-Key; ComponentLink4Description: https://datasheet.ciiva.com/29721/pyu-r-int-thick-7-29721178.pdf?src-supplier=Digi-Key; ComponentLink5URL: https://datasheet.ciiva.com/5684/443971-5684699.pdf?src-supplier=Farnell; ComponentLink5Description: https://datasheet.ciiva.com/5684/443971-5684699.pdf?src-supplier=Farnell; ComponentLink6URL: https://datasheet.ciiva.com/7983/443971-7983627.pdf?src-supplier=Element14; ComponentLink6Description: https://datasheet.ciiva.com/7983/443971-7983627.pdf?src-supplier=Element14; ComponentLink7URL: https://datasheet.ciiva.com/29721/pyu-rc0603-51-rohs-l-4-29721179.pdf?src-supplier=Digi-Key; ComponentLink7Description: https://datasheet.ciiva.com/29721/pyu-rc0603-51-rohs-l-4-29721179.pdf?src-supplier=Digi-Key; ComponentLink8URL: https://datasheet.ciiva.com/22643/1868787-22643388.pdf?src-supplier=Element14; ComponentLink8Description: https://datasheet.ciiva.com/22643/1868787-22643388.pdf?src-supplier=Element14; Supplier Part Number 1: RC0603FR-070RL
R50 = RT0603BRD07240RL: RES SMD 240 OHM 0.1% 1/10W 0603; Manufacturer: Yageo; Power Rating: 100mW; Voltage Rating: 75V; Temperature Coefficient: 25ppm/°C; Voltage Rating (DC): 50V; Supplier 1: Arrow Electronics; Manufacturer Part Number: RT0603BRD07240RL; RoHS: Yes; Category: Chip SMD Resistors; Stock 1: 5; Pricing 1: 1=0.13940 (USD); Case/Package: 0603; Case Code (Imperial): 0603; Case Code (Metric): 1608; Contact Plating: Tin,Matte; Min Operating Temperature: -55°C; Max Operating Temperature: 125°C; Resistance: 240R; Tolerance: 0.1%; Packaging: Tape and Reel; Resistor Type: Thin Film; Number of Terminations: 2; Termination: SMD/SMT; Max Power Dissipation: 100mW; Features: Moisture Resistant; Series: RT; Construction: Rectangular; Length: 1.6mm; Width: 0.031inch; Height: 0.022inch; Depth: 0.8mm; Radiation Hardening: No; Military Standard: Not; Lead Free: Lead Free; RoHS Compliant: Yes; ComponentLink1URL: https://datasheet.ciiva.com/8886/pyu-rt-1-to-0-05-rohs-l-4-8886602.pdf?src-supplier=Avnet; ComponentLink1Description: https://datasheet.ciiva.com/8886/pyu-rt-1-to-0-05-rohs-l-4-8886602.pdf?src-supplier=Avnet; ComponentLink2URL: https://datasheet.ciiva.com/12799/pyu-rt-1-to-0-05-rohs-l-4-12799039.pdf?src-supplier=Mouser; ComponentLink2Description: https://datasheet.ciiva.com/12799/pyu-rt-1-to-0-05-rohs-l-4-12799039.pdf?src-supplier=Mouser; Supplier Part Number 1: RT0603BRD07240RL
U10 = RK3399: as U10 on sheet SDIO_SDMMC_Sheet; ComponentLink1Description: Aliexpress; ComponentLink1URL: https://www.aliexpress.com/item/1005001971093459.html?spm=a2g0n.productlist.0.0.3c7csv8Qsv8Quh&browser_id=3ac7e9efb8074641aaabc4d871f09748&aff_trace_key=&aff_platform=msite&m_page_id=181389a08711fc2600d8cc522bab8d702dd4189be0&gclid=&pdp_npi=2%40dis%21USD%21%2123.6%21%21%21%21%21%402101d91e16545120399167831e8b89%21%21sea&algo_pvid=4303aedd-774c-4013-953d-920f10b55003; Manufacturer Part Number: RK3399; Footprint: FCBGA828

## Sheet DDRC_Sheet_2.SchDoc
size A4; DocumentNumber: 10; SheetNumber: 10; SheetTotal: 27
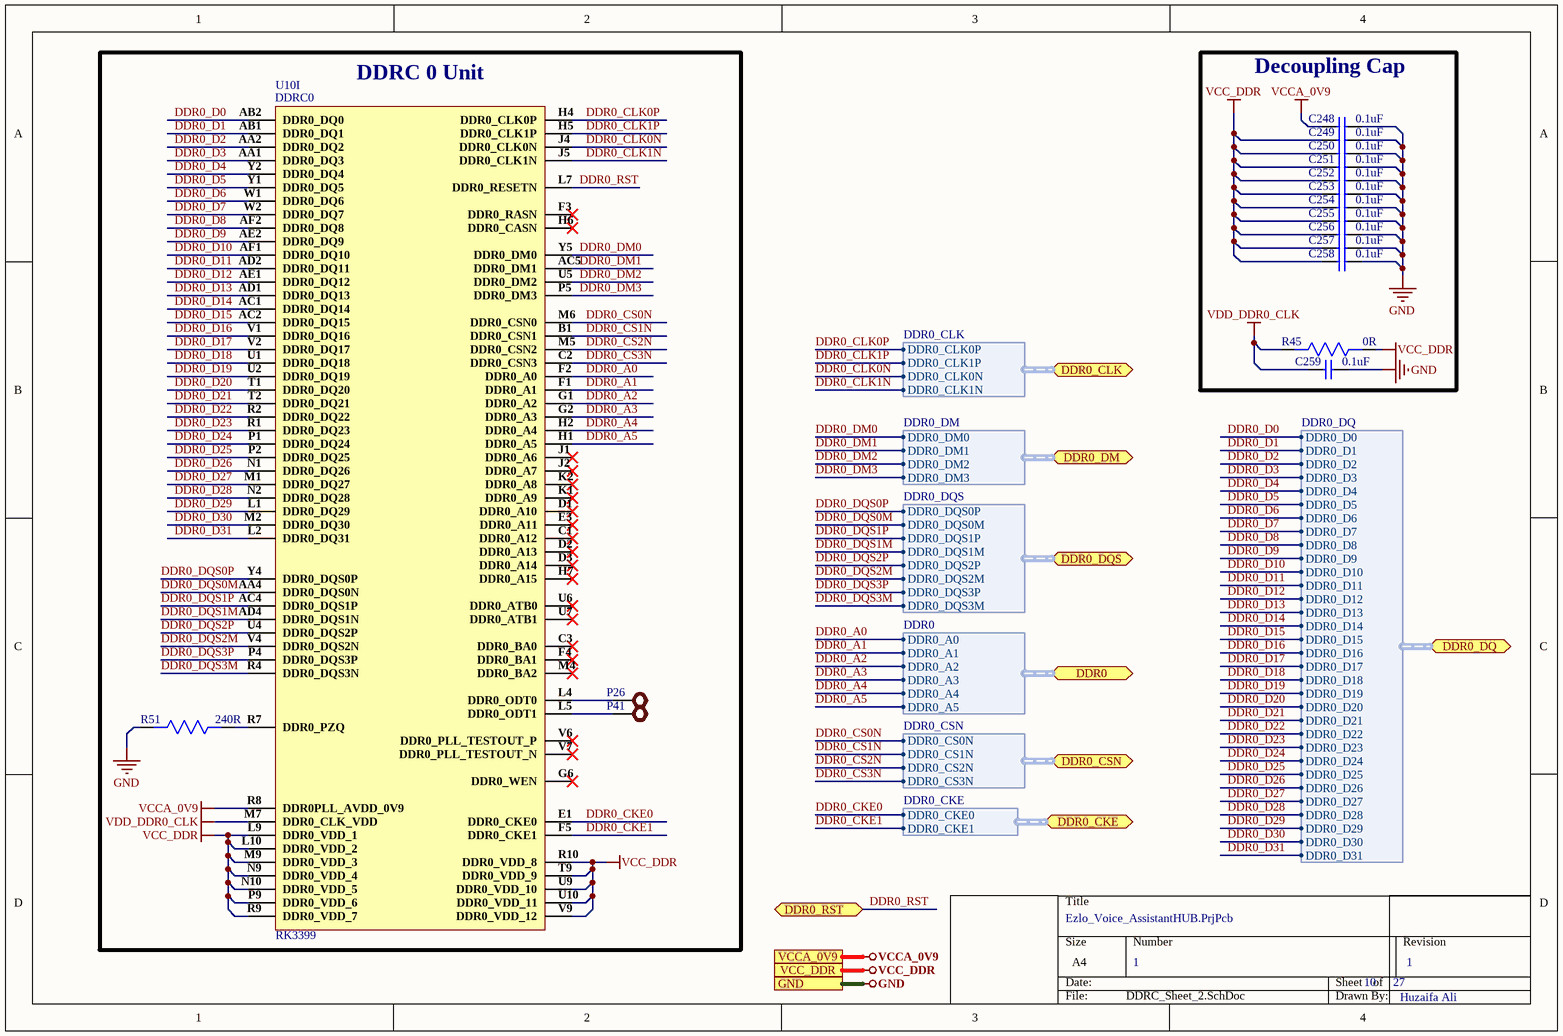
[diagram p22: DDRC_Sheet_2.SchDoc]

### Parts
C248  0.1uF  [Cap0402]
C249  0.1uF  [Cap0402]
C250  0.1uF  [Cap0402]
C251  0.1uF  [Cap0402]
C252  0.1uF  [Cap0402]
C253  0.1uF  [Cap0402]
C254  0.1uF  [Cap0402]
C255  0.1uF  [Cap0402]
C256  0.1uF  [Cap0402]
C257  0.1uF  [Cap0402]
C258  0.1uF  [Cap0402]
C259  0.1uF  [Cap0402]
P26  TEST POINT  [TEST POINT]  (value not drawn)
P41  TEST POINT  [TEST POINT]  (value not drawn)
R45  0R  [Res0603]
R51  240R  [Res0603]
U10  RK3399  [RK3399]  (part I of 34)

### Blocks framed on the sheet
DDRC 0 Unit: P26 P41 R51 U10
Decoupling Cap: C248-C259 R45

### Ports
DDR0 (bidir, harness DDR0), DDR0_CKE (bidir, harness DDR0_CKE), DDR0_CLK (bidir, harness DDR0_CLK), DDR0_CSN (bidir, harness DDR0_CSN), DDR0_DM (bidir, harness DDR0_DM), DDR0_DQ (bidir, harness DDR0_DQ), DDR0_DQS (bidir, harness DDR0_DQS), DDR0_RST (bidir), GND, VCC_DDR, VCCA_0V9

### Harnesses
DDR0_DQ: DDR0_D0, DDR0_D1, DDR0_D2, DDR0_D3, DDR0_D4, DDR0_D5, DDR0_D6, DDR0_D7, DDR0_D8, DDR0_D9, DDR0_D10, DDR0_D11, DDR0_D12, DDR0_D13, DDR0_D14, DDR0_D15, DDR0_D16, DDR0_D17, DDR0_D18, DDR0_D19, DDR0_D20, DDR0_D21, DDR0_D22, DDR0_D23, DDR0_D24, DDR0_D25, DDR0_D26, DDR0_D27, DDR0_D28, DDR0_D29, DDR0_D30, DDR0_D31
DDR0_DM: DDR0_DM0, DDR0_DM1, DDR0_DM2, DDR0_DM3
DDR0_DQS: DDR0_DQS0P, DDR0_DQS0M, DDR0_DQS1P, DDR0_DQS1M, DDR0_DQS2P, DDR0_DQS2M, DDR0_DQS3P, DDR0_DQS3M
DDR0: DDR0_A0, DDR0_A1, DDR0_A2, DDR0_A3, DDR0_A4, DDR0_A5
DDR0_CSN: DDR0_CS0N, DDR0_CS1N, DDR0_CS2N, DDR0_CS3N
DDR0_CKE: DDR0_CKE0, DDR0_CKE1
DDR0_CLK: DDR0_CLK0P, DDR0_CLK1P, DDR0_CLK0N, DDR0_CLK1N

### Nets
GND: C248.2 C249.2 C250.2 C251.2 C252.2 C253.2 C254.2 C255.2 C256.2 C257.2 C258.2 C259.2 R51.2 ; port GND
VCC_DDR: C249.1 C250.1 C251.1 C252.1 C253.1 C254.1 C255.1 C256.1 C257.1 C258.1 R45.1 U10.L9(DDR0_VDD_1) U10.L10(DDR0_VDD_2) U10.M9(DDR0_VDD_3) U10.N9(DDR0_VDD_4) U10.N10(DDR0_VDD_5) U10.P9(DDR0_VDD_6) U10.R9(DDR0_VDD_7) U10.R10(DDR0_VDD_8) U10.T9(DDR0_VDD_9) U10.U9(DDR0_VDD_10) U10.U10(DDR0_VDD_11) U10.V9(DDR0_VDD_12) ; port VCC_DDR
VCCA_0V9: C248.1 U10.R8(DDR0PLL_AVDD_0V9) ; port VCCA_0V9
VDD_DDR0_CLK: C259.1 R45.2 U10.M7(DDR0_CLK_VDD)
DDR0_A0: U10.F2(DDR0_A0) ; port DDR0.DDR0_A0  [project net DDR0.DDR0_A0]
DDR0_A1: U10.F1(DDR0_A1) ; port DDR0.DDR0_A1  [project net DDR0.DDR0_A1]
DDR0_A2: U10.G1(DDR0_A2) ; port DDR0.DDR0_A2  [project net DDR0.DDR0_A2]
DDR0_A3: U10.G2(DDR0_A3) ; port DDR0.DDR0_A3  [project net DDR0.DDR0_A3]
DDR0_A4: U10.H2(DDR0_A4) ; port DDR0.DDR0_A4  [project net DDR0.DDR0_A4]
DDR0_A5: U10.H1(DDR0_A5) ; port DDR0.DDR0_A5  [project net DDR0.DDR0_A5]
DDR0_CKE0: U10.E1(DDR0_CKE0) ; port DDR0_CKE.DDR0_CKE0  [project net DDR0_CKE.DDR0_CKE0]
DDR0_CKE1: U10.F5(DDR0_CKE1) ; port DDR0_CKE.DDR0_CKE1  [project net DDR0_CKE.DDR0_CKE1]
DDR0_CLK0N: U10.J4(DDR0_CLK0N) ; port DDR0_CLK.DDR0_CLK0N  [project net DDR0_CLK.DDR0_CLK0N]
DDR0_CLK0P: U10.H4(DDR0_CLK0P) ; port DDR0_CLK.DDR0_CLK0P  [project net DDR0_CLK.DDR0_CLK0P]
DDR0_CLK1N: U10.J5(DDR0_CLK1N) ; port DDR0_CLK.DDR0_CLK1N  [project net DDR0_CLK.DDR0_CLK1N]
DDR0_CLK1P: U10.H5(DDR0_CLK1P) ; port DDR0_CLK.DDR0_CLK1P  [project net DDR0_CLK.DDR0_CLK1P]
DDR0_CS0N: U10.M6(DDR0_CSN0) ; port DDR0_CSN.DDR0_CS0N
DDR0_CS1N: U10.B1(DDR0_CSN1) ; port DDR0_CSN.DDR0_CS1N
DDR0_CS2N: U10.M5(DDR0_CSN2) ; port DDR0_CSN.DDR0_CS2N
DDR0_CS3N: U10.C2(DDR0_CSN3) ; port DDR0_CSN.DDR0_CS3N
DDR0_D0: U10.AB2(DDR0_DQ0) ; port DDR0_DQ.DDR0_D0
DDR0_D1: U10.AB1(DDR0_DQ1) ; port DDR0_DQ.DDR0_D1
DDR0_D2: U10.AA2(DDR0_DQ2) ; port DDR0_DQ.DDR0_D2
DDR0_D3: U10.AA1(DDR0_DQ3) ; port DDR0_DQ.DDR0_D3
DDR0_D4: U10.Y2(DDR0_DQ4) ; port DDR0_DQ.DDR0_D4
DDR0_D5: U10.Y1(DDR0_DQ5) ; port DDR0_DQ.DDR0_D5
DDR0_D6: U10.W1(DDR0_DQ6) ; port DDR0_DQ.DDR0_D6
DDR0_D7: U10.W2(DDR0_DQ7) ; port DDR0_DQ.DDR0_D7
DDR0_D8: U10.AF2(DDR0_DQ8) ; port DDR0_DQ.DDR0_D8
DDR0_D9: U10.AE2(DDR0_DQ9) ; port DDR0_DQ.DDR0_D9
DDR0_D10: U10.AF1(DDR0_DQ10) ; port DDR0_DQ.DDR0_D10
DDR0_D11: U10.AD2(DDR0_DQ11) ; port DDR0_DQ.DDR0_D11
DDR0_D12: U10.AE1(DDR0_DQ12) ; port DDR0_DQ.DDR0_D12
DDR0_D13: U10.AD1(DDR0_DQ13) ; port DDR0_DQ.DDR0_D13
DDR0_D14: U10.AC1(DDR0_DQ14) ; port DDR0_DQ.DDR0_D14
DDR0_D15: U10.AC2(DDR0_DQ15) ; port DDR0_DQ.DDR0_D15
DDR0_D16: U10.V1(DDR0_DQ16) ; port DDR0_DQ.DDR0_D16
DDR0_D17: U10.V2(DDR0_DQ17) ; port DDR0_DQ.DDR0_D17
DDR0_D18: U10.U1(DDR0_DQ18) ; port DDR0_DQ.DDR0_D18
DDR0_D19: U10.U2(DDR0_DQ19) ; port DDR0_DQ.DDR0_D19
DDR0_D20: U10.T1(DDR0_DQ20) ; port DDR0_DQ.DDR0_D20
DDR0_D21: U10.T2(DDR0_DQ21) ; port DDR0_DQ.DDR0_D21
DDR0_D22: U10.R2(DDR0_DQ22) ; port DDR0_DQ.DDR0_D22
DDR0_D23: U10.R1(DDR0_DQ23) ; port DDR0_DQ.DDR0_D23
DDR0_D24: U10.P1(DDR0_DQ24) ; port DDR0_DQ.DDR0_D24
DDR0_D25: U10.P2(DDR0_DQ25) ; port DDR0_DQ.DDR0_D25
DDR0_D26: U10.N1(DDR0_DQ26) ; port DDR0_DQ.DDR0_D26
DDR0_D27: U10.M1(DDR0_DQ27) ; port DDR0_DQ.DDR0_D27
DDR0_D28: U10.N2(DDR0_DQ28) ; port DDR0_DQ.DDR0_D28
DDR0_D29: U10.L1(DDR0_DQ29) ; port DDR0_DQ.DDR0_D29
DDR0_D30: U10.M2(DDR0_DQ30) ; port DDR0_DQ.DDR0_D30
DDR0_D31: U10.L2(DDR0_DQ31) ; port DDR0_DQ.DDR0_D31
DDR0_DM0: U10.Y5(DDR0_DM0) ; port DDR0_DM.DDR0_DM0  [project net DDR0_DM.DDR0_DM0]
DDR0_DM1: U10.AC5(DDR0_DM1) ; port DDR0_DM.DDR0_DM1  [project net DDR0_DM.DDR0_DM1]
DDR0_DM2: U10.U5(DDR0_DM2) ; port DDR0_DM.DDR0_DM2  [project net DDR0_DM.DDR0_DM2]
DDR0_DM3: U10.P5(DDR0_DM3) ; port DDR0_DM.DDR0_DM3  [project net DDR0_DM.DDR0_DM3]
DDR0_DQS0M: U10.AA4(DDR0_DQS0N) ; port DDR0_DQS.DDR0_DQS0M  [project net DDR0_DQS.DDR0_DQS0M]
DDR0_DQS0P: U10.Y4(DDR0_DQS0P) ; port DDR0_DQS.DDR0_DQS0P  [project net DDR0_DQS.DDR0_DQS0P]
DDR0_DQS1M: U10.AD4(DDR0_DQS1N) ; port DDR0_DQS.DDR0_DQS1M  [project net DDR0_DQS.DDR0_DQS1M]
DDR0_DQS1P: U10.AC4(DDR0_DQS1P) ; port DDR0_DQS.DDR0_DQS1P  [project net DDR0_DQS.DDR0_DQS1P]
DDR0_DQS2M: U10.V4(DDR0_DQS2N) ; port DDR0_DQS.DDR0_DQS2M  [project net DDR0_DQS.DDR0_DQS2M]
DDR0_DQS2P: U10.U4(DDR0_DQS2P) ; port DDR0_DQS.DDR0_DQS2P  [project net DDR0_DQS.DDR0_DQS2P]
DDR0_DQS3M: U10.R4(DDR0_DQS3N) ; port DDR0_DQS.DDR0_DQS3M  [project net DDR0_DQS.DDR0_DQS3M]
DDR0_DQS3P: U10.P4(DDR0_DQS3P) ; port DDR0_DQS.DDR0_DQS3P  [project net DDR0_DQS.DDR0_DQS3P]
DDR0_RST: U10.L7(DDR0_RESETN) ; port DDR0_RST
NetP26_1: P26.1 U10.L4(DDR0_ODT0)
NetP41_1: P41.1 U10.L5(DDR0_ODT1)
NetR51_1: R51.1 U10.R7(DDR0_PZQ)

Not connected (* = marked no-connect by the designer): U10 C1(DDR0_A12)* C3(DDR0_BA0)* D1(DDR0_A10)* D2(DDR0_A13)* D3(DDR0_A14)* E3(DDR0_A11)* F3(DDR0_RASN)* F4(DDR0_BA1)* G6(DDR0_WEN)* H6(DDR0_CASN)* H7(DDR0_A15)* J1(DDR0_A6)* J2(DDR0_A7)* K1(DDR0_A9)* K2(DDR0_A8)* M4(DDR0_BA2)* U6(DDR0_ATB0)* U7(DDR0_ATB1)* V6(DDR0_PLL_TESTOUT_P)* V7(DDR0_PLL_TESTOUT_N)*

### Notes on the sheet
- 1
- Huzaifa Ali
- (in symbol RK3399, part I) DDRC0

### Library data of the parts
C248-C259 = CC0402KRX5R6BB104: as C152-C160 on sheet USB_Sheet; Supplier 1: Digi-Key; Manufacturer Part Number: CC0402KRX5R6BB104; RoHS: Yes; Category: Ceramic Capacitors; Stock 1: 6385580; Pricing 1: 1=0.10000, 10=0.02700, 50=0.01500, 100=0.01220, 500=0.00874, 1000=0.00687, 2500=0.00625, 5000=0.00575 (USD); Mount: Surface Mount; Case/Package: 0402; Number of Pins: 2; Case Code (Imperial): 0402; Case Code (Metric): 1005; Min Operating Temperature: -55°C; Max Operating Temperature: 85°C; Dielectric: X5R; Packaging: Tape and Reel; Voltage Rating: 10V; Package Quantity: 1; Termination: SMD/SMT; Voltage Rating (DC): 10V; Series: CC; Length: 1mm; Width: 0.02inch; Height: 0.5mm; Depth: 0.5mm; Thickness: 0.022inch; Radiation Hardening: No; RoHS Compliant: Yes; REACH SVHC: No SVHC; Lead Free: Lead Free; Halogen Free: Halogen Free; ComponentLink1URL: https://datasheet.ciiva.com/144/mlccorderingcode-144029.pdf?src-supplier=Digi-Key; ComponentLink1Description: https://datasheet.ciiva.com/144/mlccorderingcode-144029.pdf?src-supplier=Digi-Key; ComponentLink2URL: https://datasheet.ciiva.com/144/mlccorderingcode-144028.pdf?src-supplier=Digi-Key; ComponentLink2Description: https://datasheet.ciiva.com/144/mlccorderingcode-144028.pdf?src-supplier=Digi-Key; ComponentLink3URL: https://datasheet.ciiva.com/144/mlccorderingcode-144030.pdf?src-supplier=Digi-Key; ComponentLink3Description: https://datasheet.ciiva.com/144/mlccorderingcode-144030.pdf?src-supplier=Digi-Key; ComponentLink4URL: https://datasheet.ciiva.com/7978/1359354-7978091.pdf?src-supplier=Element14; ComponentLink4Description: https://datasheet.ciiva.com/7978/1359354-7978091.pdf?src-supplier=Element14; ComponentLink5URL: https://datasheet.ciiva.com/11587/upy-gphc-x5r-4v-to-50v-12-11587302.pdf?src-supplier=Avnet; ComponentLink5Description: https://datasheet.ciiva.com/11587/upy-gphc-x5r-4v-to-50v-12-11587302.pdf?src-supplier=Avnet; Supplier Part Number 1: 311-1336-1-ND
P26 P41 = TEST POINT: Test Point ON
R45 = RC0603FR-070RL: as R69 on sheet SDIO_SDMMC_Sheet; Supplier 1: Arrow Electronics; Manufacturer Part Number: RC0603FR-070RL; RoHS: Yes; Category: Chip SMD Resistors; Stock 1: 1270000; Pricing 1: 5000=0.00320, 5000=0.00490, 50000=0.00450, 500000=0.00250, 2500000=0.00150 (USD); Case/Package: 0603; Number of Pins: 2; Contact Plating: Tin,Matte; Case Code (Metric): 1608; Case Code (Imperial): 0603; Min Operating Temperature: -55°C; Max Operating Temperature: 155°C; Resistor Type: Thick Film; Packaging: Tape and Reel; Tolerance: 1%; Package Quantity: 5000; Voltage Rating: 50V; Number of Terminations: 2; Termination: SMD/SMT; Max Power Dissipation: 100mW; Features: Moisture Resistant; Length: 1.6mm; Width: 0.031inch; Height: 0.45mm; Depth: 0.8mm; Radiation Hardening: No; REACH SVHC: No SVHC; Lead Free: Lead Free; Military Standard: Not; ComponentLink1URL: https://datasheet.ciiva.com/11808/0900766b80f96399-11808172.pdf?src-supplier=RSComponents; ComponentLink1Description: https://datasheet.ciiva.com/11808/0900766b80f96399-11808172.pdf?src-supplier=RSComponents; ComponentLink2URL: https://datasheet.ciiva.com/5558/rc0603-272842-5558341.pdf?src-supplier=Mouser; ComponentLink2Description: https://datasheet.ciiva.com/5558/rc0603-272842-5558341.pdf?src-supplier=Mouser; ComponentLink3URL: https://datasheet.ciiva.com/46382/443971-46382072.pdf?src-supplier=Element14; ComponentLink3Description: https://datasheet.ciiva.com/46382/443971-46382072.pdf?src-supplier=Element14; ComponentLink4URL: https://datasheet.ciiva.com/29721/pyu-r-int-thick-7-29721178.pdf?src-supplier=Digi-Key; ComponentLink4Description: https://datasheet.ciiva.com/29721/pyu-r-int-thick-7-29721178.pdf?src-supplier=Digi-Key; ComponentLink5URL: https://datasheet.ciiva.com/5684/443971-5684699.pdf?src-supplier=Farnell; ComponentLink5Description: https://datasheet.ciiva.com/5684/443971-5684699.pdf?src-supplier=Farnell; ComponentLink6URL: https://datasheet.ciiva.com/7983/443971-7983627.pdf?src-supplier=Element14; ComponentLink6Description: https://datasheet.ciiva.com/7983/443971-7983627.pdf?src-supplier=Element14; ComponentLink7URL: https://datasheet.ciiva.com/29721/pyu-rc0603-51-rohs-l-4-29721179.pdf?src-supplier=Digi-Key; ComponentLink7Description: https://datasheet.ciiva.com/29721/pyu-rc0603-51-rohs-l-4-29721179.pdf?src-supplier=Digi-Key; ComponentLink8URL: https://datasheet.ciiva.com/22643/1868787-22643388.pdf?src-supplier=Element14; ComponentLink8Description: https://datasheet.ciiva.com/22643/1868787-22643388.pdf?src-supplier=Element14; Supplier Part Number 1: RC0603FR-070RL
R51 = RT0603BRD07240RL: as R50 on sheet DDRC_Section; Supplier 1: Arrow Electronics; Manufacturer Part Number: RT0603BRD07240RL; RoHS: Yes; Category: Chip SMD Resistors; Stock 1: 5; Pricing 1: 1=0.13940 (USD); Case/Package: 0603; Case Code (Imperial): 0603; Case Code (Metric): 1608; Contact Plating: Tin,Matte; Min Operating Temperature: -55°C; Max Operating Temperature: 125°C; Resistance: 240R; Tolerance: 0.1%; Packaging: Tape and Reel; Resistor Type: Thin Film; Number of Terminations: 2; Termination: SMD/SMT; Max Power Dissipation: 100mW; Features: Moisture Resistant; Series: RT; Construction: Rectangular; Length: 1.6mm; Width: 0.031inch; Height: 0.022inch; Depth: 0.8mm; Radiation Hardening: No; Military Standard: Not; Lead Free: Lead Free; RoHS Compliant: Yes; ComponentLink1URL: https://datasheet.ciiva.com/8886/pyu-rt-1-to-0-05-rohs-l-4-8886602.pdf?src-supplier=Avnet; ComponentLink1Description: https://datasheet.ciiva.com/8886/pyu-rt-1-to-0-05-rohs-l-4-8886602.pdf?src-supplier=Avnet; ComponentLink2URL: https://datasheet.ciiva.com/12799/pyu-rt-1-to-0-05-rohs-l-4-12799039.pdf?src-supplier=Mouser; ComponentLink2Description: https://datasheet.ciiva.com/12799/pyu-rt-1-to-0-05-rohs-l-4-12799039.pdf?src-supplier=Mouser; Supplier Part Number 1: RT0603BRD07240RL
U10 = RK3399: as U10 on sheet SDIO_SDMMC_Sheet; ComponentLink1Description: Aliexpress; ComponentLink1URL: https://www.aliexpress.com/item/1005001971093459.html?spm=a2g0n.productlist.0.0.3c7csv8Qsv8Quh&browser_id=3ac7e9efb8074641aaabc4d871f09748&aff_trace_key=&aff_platform=msite&m_page_id=181389a08711fc2600d8cc522bab8d702dd4189be0&gclid=&pdp_npi=2%40dis%21USD%21%2123.6%21%21%21%21%21%402101d91e16545120399167831e8b89%21%21sea&algo_pvid=4303aedd-774c-4013-953d-920f10b55003; Manufacturer Part Number: RK3399; Footprint: FCBGA828

## Sheet Memory_Section.SchDoc
size A4; DocumentNumber: 23; SheetNumber: 23; SheetTotal: 27
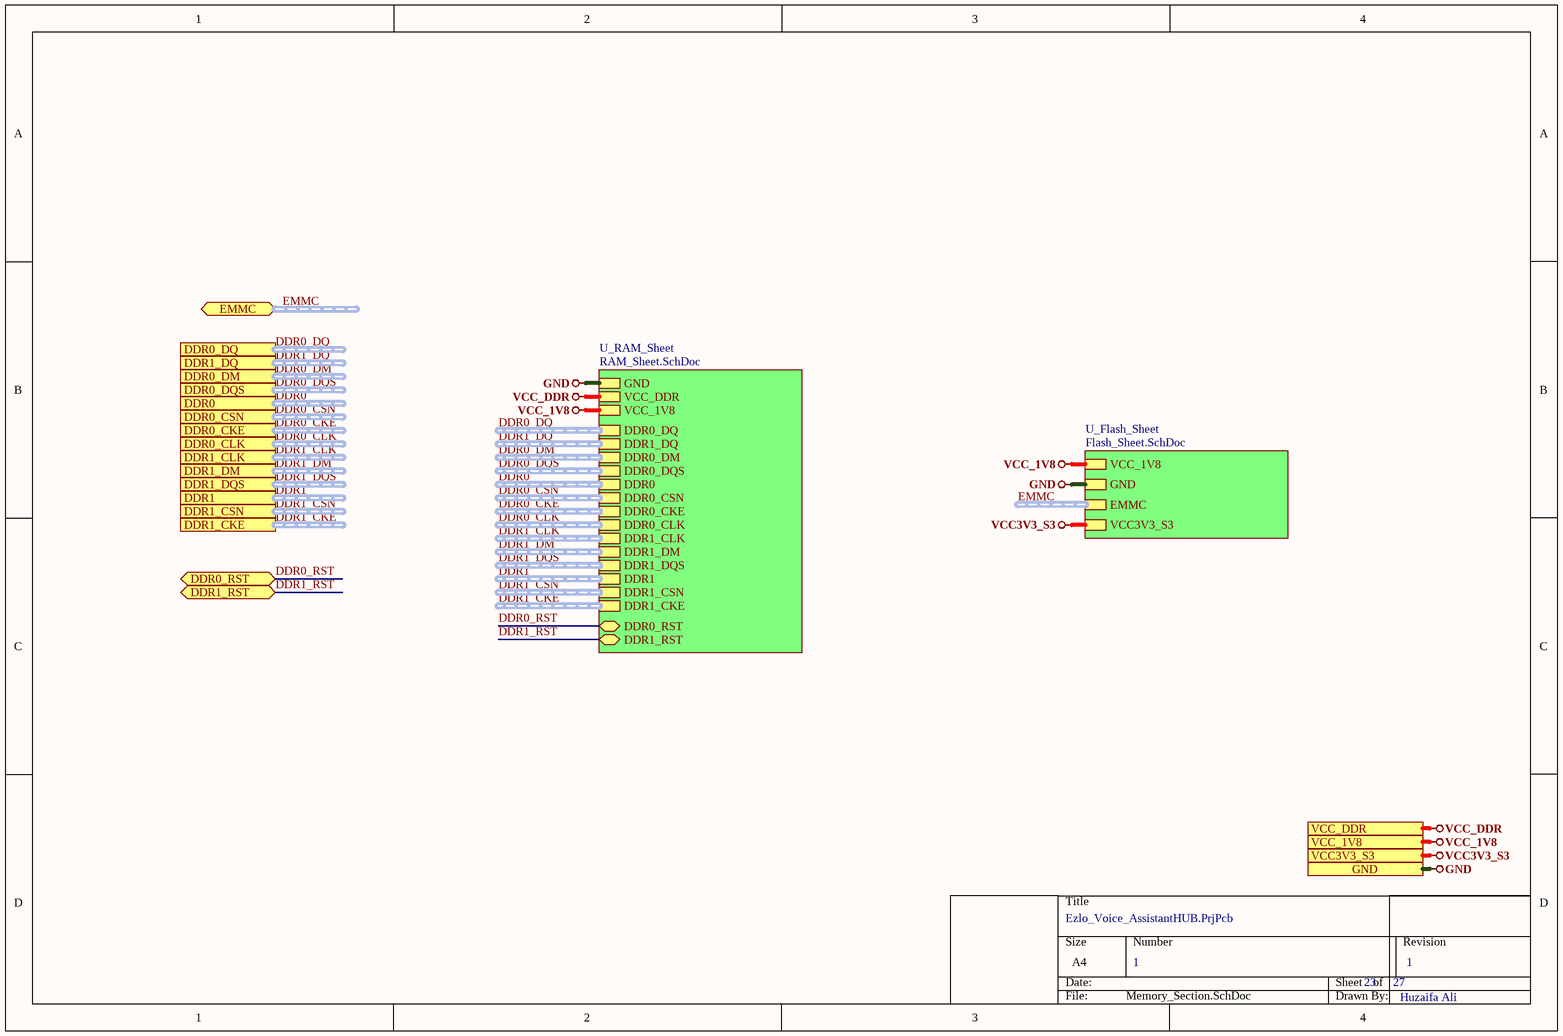
[diagram p23: Memory_Section.SchDoc]

### Sub-sheets
U_Flash_Sheet = Flash_Sheet.SchDoc: VCC_1V8, GND, EMMC (harness EMMC), VCC3V3_S3
U_RAM_Sheet = RAM_Sheet.SchDoc: GND, VCC_DDR, VCC_1V8, DDR0_DQ (harness DDR0_DQ), DDR1_DQ (harness DDR1_DQ), DDR0_DM (harness DDR0_DM), DDR0_DQS (harness DDR0_DQS), DDR0 (harness DDR0), DDR0_CSN (harness DDR0_CSN), DDR0_CKE (harness DDR0_CKE), DDR0_CLK (harness DDR0_CLK), DDR1_CLK (harness DDR1_CLK), DDR1_DM (harness DDR1_DM), DDR1_DQS (harness DDR1_DQS), DDR1 (harness DDR1), DDR1_CSN (harness DDR1_CSN), DDR1_CKE (harness DDR1_CKE), DDR0_RST (bidir), DDR1_RST (bidir)

### Ports
DDR0, DDR0_CKE, DDR0_CLK, DDR0_CSN, DDR0_DM, DDR0_DQ, DDR0_DQS, DDR0_RST (bidir), DDR1, DDR1_CKE, DDR1_CLK, DDR1_CSN, DDR1_DM, DDR1_DQ, DDR1_DQS, DDR1_RST (bidir), EMMC (bidir, harness EMMC), GND, VCC3V3_S3, VCC_1V8, VCC_DDR

### Nets
GND: port GND, sheet U_Flash_Sheet/GND, sheet U_RAM_Sheet/GND
VCC3V3_S3: port VCC3V3_S3, sheet U_Flash_Sheet/VCC3V3_S3
VCC_1V8: port VCC_1V8, sheet U_Flash_Sheet/VCC_1V8, sheet U_RAM_Sheet/VCC_1V8
VCC_DDR: port VCC_DDR, sheet U_RAM_Sheet/VCC_DDR
DDR0_RST: port DDR0_RST, sheet U_RAM_Sheet/DDR0_RST
DDR1_RST: port DDR1_RST, sheet U_RAM_Sheet/DDR1_RST

### Buses and harness runs
harness DDR0 = port DDR0
harness DDR0 = sheet U_RAM_Sheet/DDR0
harness DDR0_CKE = port DDR0_CKE
harness DDR0_CKE = sheet U_RAM_Sheet/DDR0_CKE
harness DDR0_CLK = port DDR0_CLK
harness DDR0_CLK = sheet U_RAM_Sheet/DDR0_CLK
harness DDR0_CSN = port DDR0_CSN
harness DDR0_CSN = sheet U_RAM_Sheet/DDR0_CSN
harness DDR0_DM = port DDR0_DM
harness DDR0_DM = sheet U_RAM_Sheet/DDR0_DM
harness DDR0_DQ = port DDR0_DQ
harness DDR0_DQ = sheet U_RAM_Sheet/DDR0_DQ
harness DDR0_DQS = port DDR0_DQS
harness DDR0_DQS = sheet U_RAM_Sheet/DDR0_DQS
harness DDR1 = port DDR1
harness DDR1 = sheet U_RAM_Sheet/DDR1
harness DDR1_CKE = port DDR1_CKE
harness DDR1_CKE = sheet U_RAM_Sheet/DDR1_CKE
harness DDR1_CLK = port DDR1_CLK
harness DDR1_CLK = sheet U_RAM_Sheet/DDR1_CLK
harness DDR1_CSN = port DDR1_CSN
harness DDR1_CSN = sheet U_RAM_Sheet/DDR1_CSN
harness DDR1_DM = port DDR1_DM
harness DDR1_DM = sheet U_RAM_Sheet/DDR1_DM
harness DDR1_DQ = port DDR1_DQ
harness DDR1_DQ = sheet U_RAM_Sheet/DDR1_DQ
harness DDR1_DQS = port DDR1_DQS
harness DDR1_DQS = sheet U_RAM_Sheet/DDR1_DQS
harness EMMC = port EMMC
harness EMMC = sheet U_Flash_Sheet/EMMC

### Notes on the sheet
- 1
- Huzaifa Ali

## Sheet Flash_Sheet.SchDoc
size A4; DocumentNumber: 26; SheetNumber: 26; SheetTotal: 27
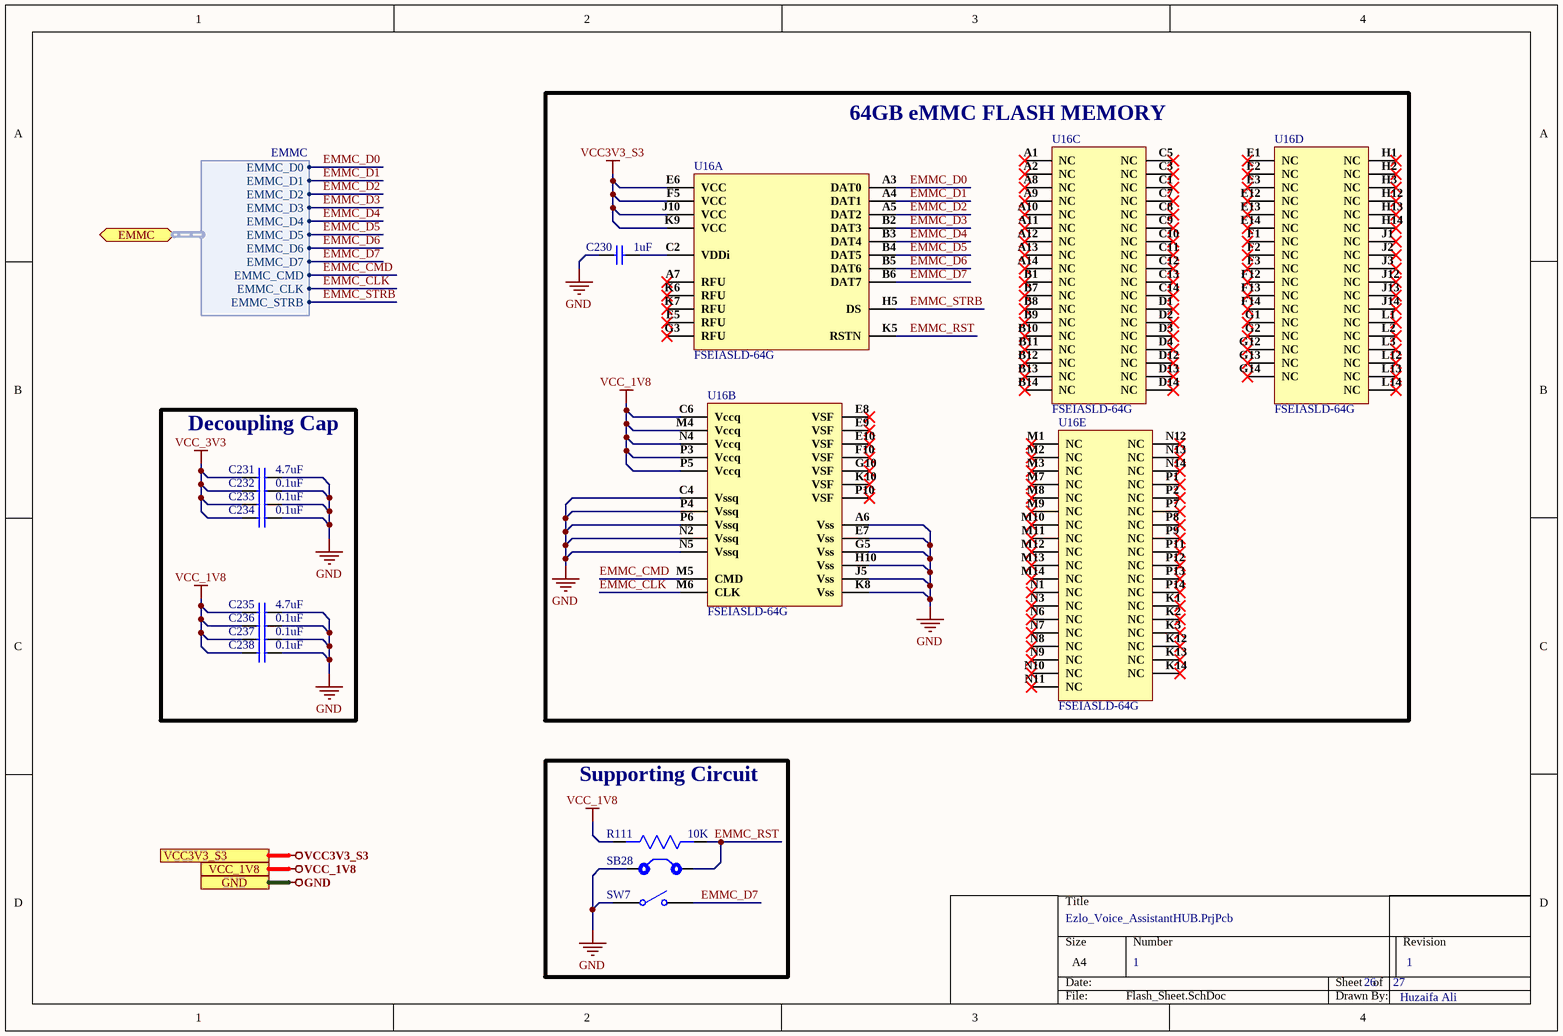
[diagram p24: Flash_Sheet.SchDoc]

### Parts
C230  1uF  [Cap0402]
C231  4.7uF  [Cap 0402]
C232  0.1uF  [Cap 0402]
C233  0.1uF  [Cap 0402]
C234  0.1uF  [Cap 0402]
C235  4.7uF  [Cap 0402]
C236  0.1uF  [Cap 0402]
C237  0.1uF  [Cap 0402]
C238  0.1uF  [Cap 0402]
R111  10K  [Res0603]
SB28  Solder Bridge  [Solder Bridge]  (value not drawn)
SW7  TS-1185EC-C-D-B  [TS-1185EC-C-D-B]  (value not drawn)
U16  FSEIASLD-64G  [BGA-153]  (parts A,B,C,D,E of 5)

### Blocks framed on the sheet
64GB eMMC FLASH MEMORY: C230 U16
Decoupling Cap: C231-C238
Supporting Circuit: R111 SB28 SW7

### Ports
EMMC (bidir, harness EMMC), GND, VCC3V3_S3, VCC_1V8

### Harnesses
EMMC: EMMC_D0, EMMC_D1, EMMC_D2, EMMC_D3, EMMC_D4, EMMC_D5, EMMC_D6, EMMC_D7, EMMC_CMD, EMMC_CLK, EMMC_STRB

### Nets
GND: C230.1 C231.2 C232.2 C233.2 C234.2 C235.2 C236.2 C237.2 C238.2 SB28.1 SW7.1 U16.A6(Vss) U16.C4(Vssq) U16.E7(Vss) U16.G5(Vss) U16.H10(Vss) U16.J5(Vss) U16.K8(Vss) U16.N2(Vssq) U16.N5(Vssq) U16.P4(Vssq) U16.P6(Vssq) ; port GND
VCC3V3_S3: U16.E6(VCC) U16.F5(VCC) U16.J10(VCC) U16.K9(VCC) ; port VCC3V3_S3
VCC_1V8: C235.1 C236.1 C237.1 C238.1 R111.2 U16.C6(Vccq) U16.M4(Vccq) U16.N4(Vccq) U16.P3(Vccq) U16.P5(Vccq) ; port VCC_1V8
VCC_3V3: C231.1 C232.1 C233.1 C234.1
EMMC_CLK: U16.M6(CLK) ; port EMMC.EMMC_CLK  [project net EMMC.EMMC_CLK]
EMMC_CMD: U16.M5(CMD) ; port EMMC.EMMC_CMD  [project net EMMC.EMMC_CMD]
EMMC_D0: U16.A3(DAT0) ; port EMMC.EMMC_D0  [project net EMMC.EMMC_D0]
EMMC_D1: U16.A4(DAT1) ; port EMMC.EMMC_D1  [project net EMMC.EMMC_D1]
EMMC_D2: U16.A5(DAT2) ; port EMMC.EMMC_D2  [project net EMMC.EMMC_D2]
EMMC_D3: U16.B2(DAT3) ; port EMMC.EMMC_D3  [project net EMMC.EMMC_D3]
EMMC_D4: U16.B3(DAT4) ; port EMMC.EMMC_D4  [project net EMMC.EMMC_D4]
EMMC_D5: U16.B4(DAT5) ; port EMMC.EMMC_D5  [project net EMMC.EMMC_D5]
EMMC_D6: U16.B5(DAT6) ; port EMMC.EMMC_D6  [project net EMMC.EMMC_D6]
EMMC_D7: SW7.2 U16.B6(DAT7) ; port EMMC.EMMC_D7  [project net EMMC.EMMC_D7]
EMMC_RST: R111.1 SB28.2 U16.K5(RSTN)
EMMC_STRB: U16.H5(DS) ; port EMMC.EMMC_STRB  [project net EMMC.EMMC_STRB]
NetC230_2: C230.2 U16.C2(VDDi)

Not connected (* = marked no-connect by the designer): U16 A1(NC)* A2(NC)* A7(RFU)* A8(NC)* A9(NC)* A10(NC)* A11(NC)* A12(NC)* A13(NC)* A14(NC)* B1(NC)* B7(NC)* B8(NC)* B9(NC)* B10(NC)* B11(NC)* B12(NC)* B13(NC)* B14(NC)* C1(NC)* C3(NC)* C5(NC)* C7(NC)* C8(NC)* C9(NC)* C10(NC)* C11(NC)* C12(NC)* C13(NC)* C14(NC)* D1(NC)* D2(NC)* D3(NC)* D4(NC)* D12(NC)* D13(NC)* D14(NC)* E1(NC)* E2(NC)* E3(NC)* E5(RFU)* E8(VSF)* E9(VSF)* E10(VSF)* E12(NC)* E13(NC)* E14(NC)* F1(NC)* F2(NC)* F3(NC)* F10(VSF)* F12(NC)* F13(NC)* F14(NC)* G1(NC)* G2(NC)* G3(RFU)* G10(VSF)* G12(NC)* G13(NC)* G14(NC)* H1(NC)* H2(NC)* H3(NC)* H12(NC)* H13(NC)* H14(NC)* J1(NC)* J2(NC)* J3(NC)* J12(NC)* J13(NC)* J14(NC)* K1(NC)* K2(NC)* K3(NC)* K6(RFU)* K7(RFU)* K10(VSF)* K12(NC)* K13(NC)* K14(NC)* L1(NC)* L2(NC)* L3(NC)* L12(NC)* L13(NC)* L14(NC)* M1(NC)* M2(NC)* M3(NC)* M7(NC)* M8(NC)* M9(NC)* M10(NC)* M11(NC)* M12(NC)* M13(NC)* M14(NC)* N1(NC)* N3(NC)* N6(NC)* N7(NC)* N8(NC)* N9(NC)* N10(NC)* N11(NC)* N12(NC)* N13(NC)* N14(NC)* P1(NC)* P2(NC)* P7(NC)* P8(NC)* P9(NC)* P10(VSF)* P11(NC)* P12(NC)* P13(NC)* P14(NC)*

### Notes on the sheet
- 1
- Huzaifa Ali

### Library data of the parts
C230 = GRM155R61E105KA12D: CAP CER 1UF 25V X5R 0402; Manufacturer: Murata; Material: Ceramic; Tolerance: 10%; Supplier 1: Digi-Key; Manufacturer Part Number: GRM155R61E105KA12D; Stock 1: 1194305; Pricing 1: 1=0.11, 10=0.077, 100=0.0363, 500=0.02546, 1000=0.02108, 2500=0.01962, 5000=0.01795 (USD); Mount: Surface Mount; Case/Package: 0402; Weight: 0.000212oz; Case Code (Metric): 1005; Case Code (Imperial): 0402; Min Operating Temperature: -55°C; Max Operating Temperature: 85°C; Capacitance: 1uF; Voltage Rating: 25V; Packaging: Tape and Reel; Dielectric: X5R; Voltage: 25V; Termination: SMD/SMT; Voltage Rating (DC): 25V; Package Quantity: 10000; Length: 1mm; Height: 0.5mm; Width: 0.5mm; Thickness: 0.022inch; Depth: 0.5mm; REACH SVHC: No SVHC; Lead Free: Lead Free; ComponentLink1URL: http://www.farnell.com/datasheets/2048341.pdf?src-supplier=Element14; ComponentLink1Description: http://www.farnell.com/datasheets/2048341.pdf?src-supplier=Element14; Supplier Part Number 1: 490-10017-1-ND
C231 C235 = EDK105BBJ475MVLF: 16V 4.7uF ±20% 0402 Multilayer Ceramic Capacitors MLCC; Manufacturer: Taiyo Yuden; Manufacturer Part Number: EDK105BBJ475MVLF; Footprint: 0402; Value: 4.7uF
C232-C234 C236-C238 = GRM155R71H104ME14D: CAP CER 0.1UF 50V X7R 0402; Manufacturer: Murata; Tolerance: 20%; Capacitance: 100nF; Supplier 1: Digi-Key; Manufacturer Part Number: GRM155R71H104ME14D; Stock 1: 439844; Pricing 1: 1=0.1, 10=0.038, 100=0.0168, 500=0.01198, 1000=0.00941, 2500=0.00855, 5000=0.00787 (USD); Mount: Surface Mount; Case/Package: 0402; Min Operating Temperature: -55°C; Max Operating Temperature: 125°C; Packaging: Cut Tape; Voltage Rating: 50V; Length: 0.039inch; Width: 0.02inch; Thickness: 0.022inch; ComponentLink1URL: http://search.murata.co.jp/Ceramy/image/img/A01X/G101/ENG/GRM155R71H104ME14-01.pdf?src-supplier=Digi-Key; ComponentLink1Description: http://search.murata.co.jp/Ceramy/image/img/A01X/G101/ENG/GRM155R71H104ME14-01.pdf?src-supplier=Digi-Key; ComponentLink2URL: http://psearch.en.murata.com/capacitor/product/GRM155R71H104ME14%23.pdf?src-supplier=Avnet; ComponentLink2Description: http://psearch.en.murata.com/capacitor/product/GRM155R71H104ME14%23.pdf?src-supplier=Avnet; ComponentLink3URL: http://components.arrow.com/part/dataview/0323_07177683?src-supplier=Arrow+Europe; ComponentLink3Description: http://components.arrow.com/part/dataview/0323_07177683?src-supplier=Arrow+Europe; ComponentLink4URL: http://www.mouser.com/ds/2/281/c02e-2905.pdf?src-supplier=Mouser; ComponentLink4Description: http://www.mouser.com/ds/2/281/c02e-2905.pdf?src-supplier=Mouser; Supplier Part Number 1: 490-10701-1-ND
R111 = AC0603JR-0710KL: RES SMD 10K OHM 5% 1/10W 0603; Manufacturer: Yageo; Voltage Rating: 50V; Resistance: 10kR; Power Rating: 100mW; Temperature Coefficient: 100ppm/°C; Supplier 1: Future Electronics; Manufacturer Part Number: AC0603JR-0710KL; RoHS: Yes; Category: Chip SMD Resistors; Stock 1: 1533000; Pricing 1: 5000=0.00540 (USD); Case/Package: 0603; Case Code (Imperial): 0603; Case Code (Metric): 1608; Size Code: 0603; Min Operating Temperature: -55°C; Max Operating Temperature: 155°C; Packaging: Tape and Reel; Tolerance: 5%; Package Quantity: 1; Resistor Type: Thick Film; Termination: SMD/SMT; Number of Terminations: 2; Max Power Dissipation: 100mW; Features: Moisture Resistant,Automotive AEC-Q200,Anti-Sulfur; Series: AC; Construction: Rectangular; Length: 0.063inch; Width: 0.031inch; Height: 0.022inch; Depth: 0.8mm; Military Standard: Not; Lead Free: Lead Free; RoHS Compliant: Yes; ComponentLink1URL: https://datasheet.ciiva.com/5562/pyu-ac-51-rohs-l-2-5562553.pdf?src-supplier=Mouser; ComponentLink1Description: https://datasheet.ciiva.com/5562/pyu-ac-51-rohs-l-2-5562553.pdf?src-supplier=Mouser; Supplier Part Number 1: 1029044
SB28 = Solder Bridge: Solder Bridge ON
SW7 = TS-1185EC-C-D-B: 3mm 2mm Round Button 50mA Top3.65mm SPST 12V SMD Tactile Switches; Manufacturer: XKB; Manufacturer Part Number: TS-1185EC-C-D-B; Footprint: Custom; ComponentLink1Description: LCSC; ComponentLink1URL: https://lcsc.com/product-detail/Tactile-Switches_XKB-Connectivity-TS-1185EC-C-D-B_C318893.html
U16 = FSEIASLD-64G: BGA-153 eMMC ROHS; Manufacturer: FORESEE; Manufacturer Part Number: FSEIASLD-64G; ComponentLink1Description: LCSC; ComponentLink1URL: https://lcsc.com/product-detail/eMMC_FORESEE-FSEIASLD-64G_C719922.html